# EAGLE schematic eagle-mr90 (EAGLE 9.6.2)
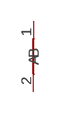
[diagram p0: schematic, sheet 1]

## Parts
R1  D  [P]
R2  D  [P]
Unconnected: R1.1(A) R1.2(B) R2.1(A) R2.2(B)

## Library data of the parts
R1 R2 = l:D